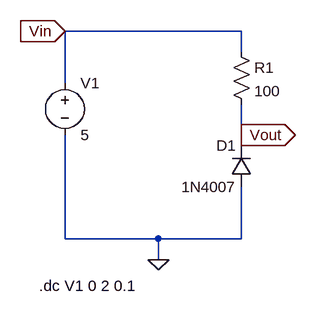
[diagram p0: schematic part1-3.1.asc]
part1-3.1.asc, the LTspice schematic file:
Version 4.1
SHEET 1 880 680
WIRE 320 32 48 32
WIRE 320 64 320 32
WIRE 48 112 48 32
WIRE 320 192 320 144
WIRE 320 208 320 192
WIRE 48 352 48 192
WIRE 192 352 48 352
WIRE 320 352 320 272
WIRE 320 352 192 352
WIRE 192 384 192 352
FLAG 192 384 0
FLAG 48 32 Vin
IOPIN 48 32 In
FLAG 320 192 Vout
IOPIN 320 192 Out
SYMBOL voltage 48 96 R0
WINDOW 123 0 0 Left 0
WINDOW 39 0 0 Left 0
SYMATTR InstName V1
SYMATTR Value 5
SYMBOL diode 336 272 R180
WINDOW 0 24 64 Left 2
WINDOW 3 24 0 Left 2
SYMATTR InstName D1
SYMATTR Value 1N4007
SYMBOL res 304 48 R0
SYMATTR InstName R1
SYMATTR Value 100
TEXT 8 424 Left 2 !.dc V1 0 2 0.1

The netlist it stands for:
* part1-3.1.asc
V1 Vin 0 5
D1 0 Vout 1N4007
R1 Vin Vout 100
.model D D
.lib standard.dio
.dc V1 0 2 0.1
.backanno
.end